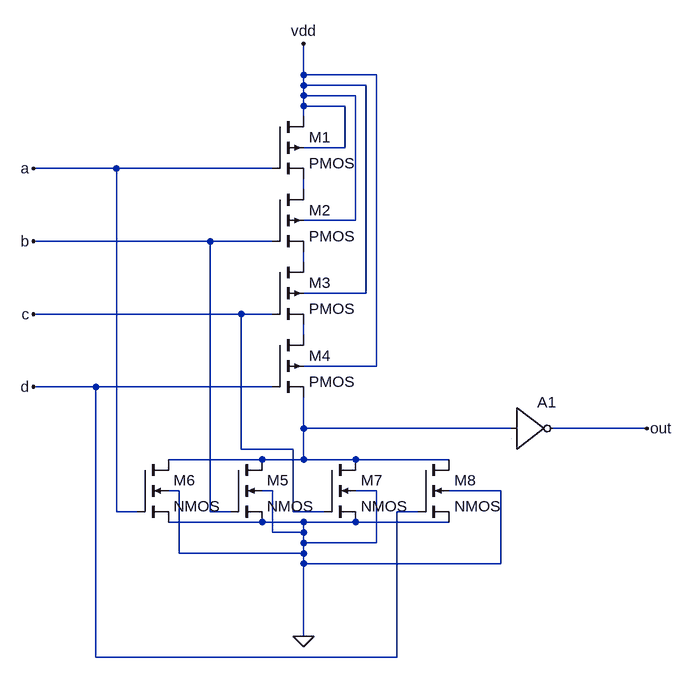
[diagram p0: schematic cmos_4input_or_gate.asc]
cmos_4input_or_gate.asc, the LTspice schematic file:
Version 4
SHEET 1 880 884
WIRE 208 -16 208 -64
WIRE 320 -16 208 -16
WIRE 208 0 208 -16
WIRE 304 0 208 0
WIRE 208 16 208 0
WIRE 288 16 208 16
WIRE 208 32 208 16
WIRE 272 32 208 32
WIRE 208 48 208 32
WIRE 272 96 272 32
WIRE 272 96 208 96
WIRE -80 128 -208 128
WIRE 160 128 -80 128
WIRE 208 160 208 144
WIRE 288 208 288 16
WIRE 288 208 208 208
WIRE 64 240 -208 240
WIRE 160 240 64 240
WIRE 208 272 208 256
WIRE 304 320 304 0
WIRE 304 320 208 320
WIRE 112 352 -208 352
WIRE 160 352 112 352
WIRE 208 384 208 368
WIRE 320 432 320 -16
WIRE 320 432 208 432
WIRE -112 464 -208 464
WIRE 160 464 -112 464
WIRE 208 528 208 480
WIRE 528 528 208 528
WIRE 736 528 592 528
WIRE 112 560 112 352
WIRE 192 560 112 560
WIRE 144 576 0 576
WIRE 208 576 208 528
WIRE 208 576 144 576
WIRE 288 576 208 576
WIRE 432 576 288 576
WIRE 16 624 0 624
WIRE 160 624 144 624
WIRE 320 624 288 624
WIRE 512 624 432 624
WIRE -80 656 -80 128
WIRE -48 656 -80 656
WIRE 64 656 64 240
WIRE 96 656 64 656
WIRE 192 656 192 560
WIRE 240 656 192 656
WIRE 384 656 352 656
WIRE 144 672 0 672
WIRE 208 672 144 672
WIRE 288 672 208 672
WIRE 432 672 288 672
WIRE 160 688 160 624
WIRE 208 688 208 672
WIRE 208 688 160 688
WIRE 208 704 208 688
WIRE 320 704 320 624
WIRE 320 704 208 704
WIRE 16 720 16 624
WIRE 208 720 208 704
WIRE 208 720 16 720
WIRE 208 736 208 720
WIRE 512 736 512 624
WIRE 512 736 208 736
WIRE 208 848 208 736
WIRE -112 880 -112 464
WIRE 352 880 352 656
WIRE 352 880 -112 880
FLAG 208 848 0
FLAG 736 528 out
FLAG -208 128 a
FLAG -208 240 b
FLAG -208 352 c
FLAG -208 464 d
FLAG 208 -64 vdd
SYMBOL pmos4 160 48 R0
SYMATTR InstName M1
SYMBOL pmos4 160 160 R0
SYMATTR InstName M2
SYMBOL pmos4 160 272 R0
SYMATTR InstName M3
SYMBOL pmos4 160 384 R0
SYMATTR InstName M4
SYMBOL nmos4 96 576 R0
SYMATTR InstName M5
SYMBOL nmos4 -48 576 R0
SYMATTR InstName M6
SYMBOL nmos4 240 576 R0
SYMATTR InstName M7
SYMBOL nmos4 384 576 R0
SYMATTR InstName M8
SYMBOL Digital\\inv 528 464 R0
SYMATTR InstName A1

The netlist it stands for:
* cmos_4input_or_gate.asc
M1 vdd a N001 vdd PMOS
M2 N001 b N002 vdd PMOS
M3 N002 c N003 vdd PMOS
M4 N003 d N004 vdd PMOS
M5 N004 b 0 0 NMOS
M6 N004 a 0 0 NMOS
M7 N004 c 0 0 NMOS
M8 N004 d 0 0 NMOS
A1 N004 0 0 0 0 out 0 0 BUF
.model NMOS NMOS
.model PMOS PMOS
.lib standard.mos
.backanno
.end